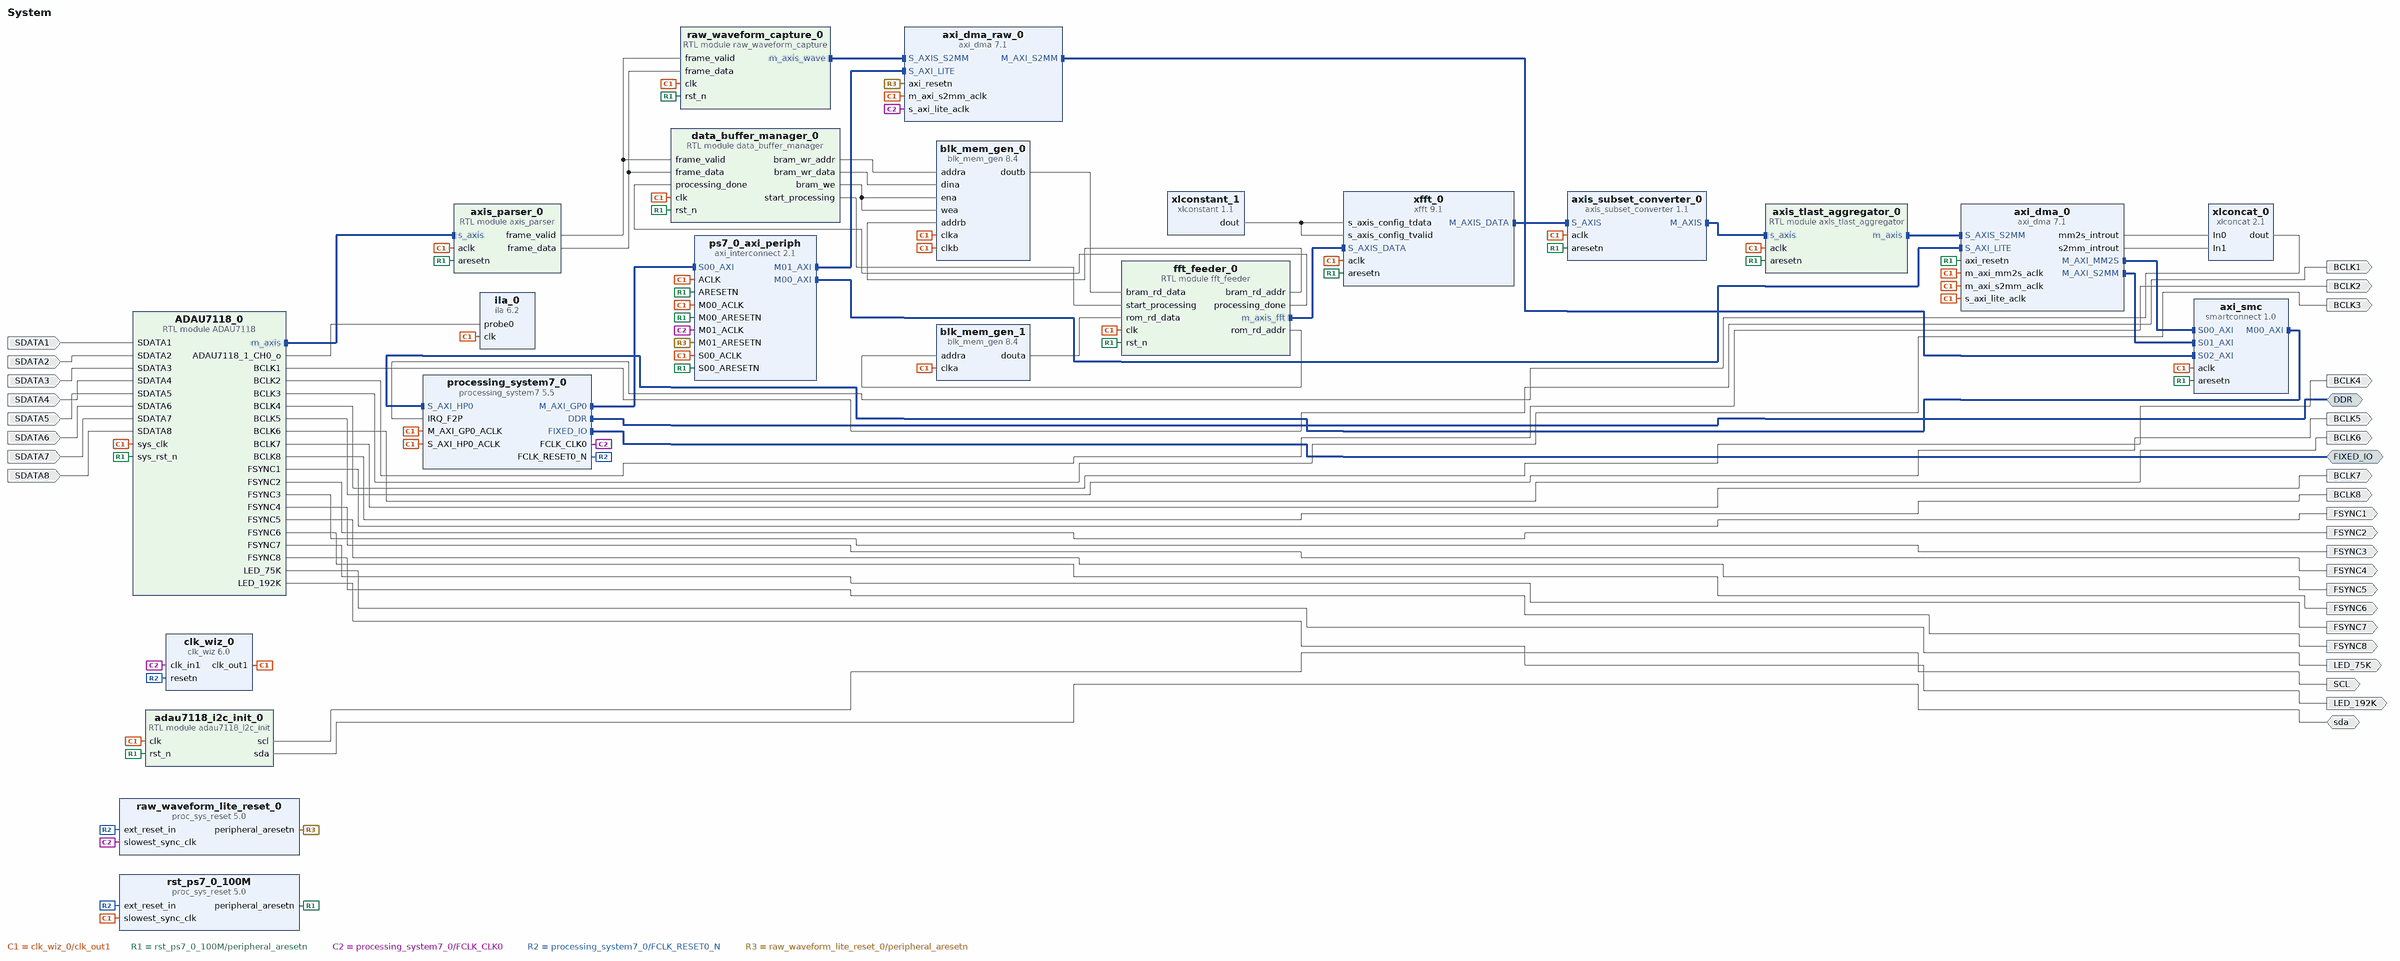
[diagram p0: block diagram of the top level]
# Vivado block design System, xc7z020clg400-2, Vivado 2018.3
create_bd_design System

create_bd_intf_port -mode Master -vlnv xilinx.com:interface:ddrx_rtl:1.0 DDR
create_bd_intf_port -mode Master -vlnv xilinx.com:display_processing_system7:fixedio_rtl:1.0 FIXED_IO
create_bd_port -dir I SDATA1
create_bd_port -dir I SDATA2
create_bd_port -dir I SDATA3
create_bd_port -dir I SDATA4
create_bd_port -dir I SDATA5
create_bd_port -dir I SDATA6
create_bd_port -dir I SDATA7
create_bd_port -dir I SDATA8
create_bd_port -dir O BCLK1
create_bd_port -dir O BCLK2
create_bd_port -dir O BCLK3
create_bd_port -dir O BCLK4
create_bd_port -dir O BCLK5
create_bd_port -dir O BCLK6
create_bd_port -dir O BCLK7
create_bd_port -dir O BCLK8
create_bd_port -dir O FSYNC1
create_bd_port -dir O FSYNC2
create_bd_port -dir O FSYNC3
create_bd_port -dir O FSYNC4
create_bd_port -dir O FSYNC5
create_bd_port -dir O FSYNC6
create_bd_port -dir O FSYNC7
create_bd_port -dir O FSYNC8
create_bd_port -dir O SCL
create_bd_port -dir IO sda
create_bd_port -dir O LED_75K
create_bd_port -dir O LED_192K

create_bd_cell -type module -reference axis_parser axis_parser_0
create_bd_cell -type module -reference data_buffer_manager data_buffer_manager_0
create_bd_cell -type module -reference axis_tlast_aggregator axis_tlast_aggregator_0
create_bd_cell -type module -reference fft_feeder fft_feeder_0
create_bd_cell -type ip -vlnv xilinx.com:ip:axi_dma:7.1 axi_dma_0
set_property -dict [list \
  CONFIG.c_addr_width 32 \
  CONFIG.c_include_mm2s_dre 1 \
  CONFIG.c_include_s2mm 1 \
  CONFIG.c_include_s2mm_dre 1 \
  CONFIG.c_include_sg 0 \
  CONFIG.c_m_axi_mm2s_data_width 128 \
  CONFIG.c_m_axi_s2mm_data_width 64 \
  CONFIG.c_m_axis_mm2s_tdata_width 128 \
  CONFIG.c_mm2s_burst_size 256 \
  CONFIG.c_s2mm_burst_size 32 \
  CONFIG.c_sg_length_width 23 \
] [get_bd_cells axi_dma_0]
create_bd_cell -type ip -vlnv xilinx.com:ip:smartconnect:1.0 axi_smc
set_property -dict {CONFIG.NUM_SI 3} [get_bd_cells axi_smc]
create_bd_cell -type ip -vlnv xilinx.com:ip:axis_subset_converter:1.1 axis_subset_converter_0
set_property -dict [list \
  CONFIG.M_HAS_TLAST 1 \
  CONFIG.M_TDATA_NUM_BYTES 8 \
  CONFIG.M_TUSER_WIDTH 8 \
  CONFIG.S_HAS_TLAST 1 \
  CONFIG.S_TDATA_NUM_BYTES 6 \
  CONFIG.S_TUSER_WIDTH 8 \
  CONFIG.TDATA_REMAP {16'b0,tdata[47:0]} \
  CONFIG.TLAST_REMAP {tlast[0]} \
  CONFIG.TUSER_REMAP {tuser[7:0]} \
] [get_bd_cells axis_subset_converter_0]
create_bd_cell -type ip -vlnv xilinx.com:ip:blk_mem_gen:8.4 blk_mem_gen_0
set_property -dict [list \
  CONFIG.Assume_Synchronous_Clk true \
  CONFIG.Enable_32bit_Address false \
  CONFIG.Enable_A Use_ENA_Pin \
  CONFIG.Enable_B Always_Enabled \
  CONFIG.Memory_Type True_Dual_Port_RAM \
  CONFIG.Port_B_Clock 100 \
  CONFIG.Port_B_Enable_Rate 100 \
  CONFIG.Port_B_Write_Rate 50 \
  CONFIG.Read_Width_A 1024 \
  CONFIG.Read_Width_B 1024 \
  CONFIG.Register_PortA_Output_of_Memory_Primitives false \
  CONFIG.Register_PortB_Output_of_Memory_Primitives true \
  CONFIG.Use_Byte_Write_Enable false \
  CONFIG.Use_RSTA_Pin false \
  CONFIG.Write_Depth_A 128 \
  CONFIG.Write_Width_A 1024 \
  CONFIG.Write_Width_B 1024 \
  CONFIG.use_bram_block Stand_Alone \
] [get_bd_cells blk_mem_gen_0]
create_bd_cell -type ip -vlnv xilinx.com:ip:blk_mem_gen:8.4 blk_mem_gen_1
set_property -dict [list \
  CONFIG.Coe_File ../../../../../../hanning_128.coe \
  CONFIG.Enable_32bit_Address false \
  CONFIG.Enable_A Always_Enabled \
  CONFIG.Fill_Remaining_Memory_Locations true \
  CONFIG.Load_Init_File true \
  CONFIG.Memory_Type Single_Port_ROM \
  CONFIG.Port_A_Write_Rate 0 \
  CONFIG.Register_PortA_Output_of_Memory_Primitives true \
  CONFIG.Use_RSTA_Pin false \
  CONFIG.Write_Depth_A 128 \
  CONFIG.Write_Width_A 16 \
  CONFIG.use_bram_block Stand_Alone \
] [get_bd_cells blk_mem_gen_1]
create_bd_cell -type ip -vlnv xilinx.com:ip:clk_wiz:6.0 clk_wiz_0
set_property -dict [list \
  CONFIG.CLKOUT1_JITTER 188.932 \
  CONFIG.CLKOUT1_PHASE_ERROR 297.349 \
  CONFIG.CLKOUT1_REQUESTED_OUT_FREQ 196.608 \
  CONFIG.CLKOUT2_JITTER 221.222 \
  CONFIG.CLKOUT2_PHASE_ERROR 117.869 \
  CONFIG.CLKOUT2_REQUESTED_OUT_FREQ 12.288 \
  CONFIG.CLKOUT2_USED false \
  CONFIG.MMCM_CLKFBOUT_MULT_F 57.750 \
  CONFIG.MMCM_CLKOUT0_DIVIDE_F 5.875 \
  CONFIG.MMCM_CLKOUT1_DIVIDE 1 \
  CONFIG.MMCM_DIVCLK_DIVIDE 5 \
  CONFIG.NUM_OUT_CLKS 1 \
  CONFIG.RESET_PORT resetn \
  CONFIG.RESET_TYPE ACTIVE_LOW \
  CONFIG.USE_LOCKED false \
] [get_bd_cells clk_wiz_0]
create_bd_cell -type ip -vlnv xilinx.com:ip:ila:6.2 ila_0
set_property -dict [list \
  CONFIG.C_DATA_DEPTH 8192 \
  CONFIG.C_ENABLE_ILA_AXI_MON false \
  CONFIG.C_MONITOR_TYPE Native \
  CONFIG.C_NUM_OF_PROBES 1 \
  CONFIG.C_PROBE1_WIDTH 1 \
  CONFIG.C_PROBE2_WIDTH 1 \
  CONFIG.C_PROBE3_WIDTH 1 \
] [get_bd_cells ila_0]
create_bd_cell -type ip -vlnv xilinx.com:ip:processing_system7:5.5 processing_system7_0
set_property -dict [list \
  CONFIG.PCW_APU_PERIPHERAL_FREQMHZ 666.666666 \
  CONFIG.PCW_CPU_CPU_6X4X_MAX_RANGE 767 \
  CONFIG.PCW_ENET0_ENET0_IO {MIO 16 .. 27} \
  CONFIG.PCW_ENET0_GRP_MDIO_ENABLE 1 \
  CONFIG.PCW_ENET0_GRP_MDIO_IO {MIO 52 .. 53} \
  CONFIG.PCW_ENET0_PERIPHERAL_ENABLE 1 \
  CONFIG.PCW_FPGA0_PERIPHERAL_FREQMHZ 100 \
  CONFIG.PCW_FPGA1_PERIPHERAL_FREQMHZ 50 \
  CONFIG.PCW_GPIO_MIO_GPIO_ENABLE 0 \
  CONFIG.PCW_IRQ_F2P_INTR 1 \
  CONFIG.PCW_PERIPHERAL_BOARD_PRESET None \
  CONFIG.PCW_PRESET_BANK1_VOLTAGE {LVCMOS 1.8V} \
  CONFIG.PCW_QSPI_GRP_SINGLE_SS_ENABLE 1 \
  CONFIG.PCW_QSPI_GRP_SINGLE_SS_IO {MIO 1 .. 6} \
  CONFIG.PCW_QSPI_PERIPHERAL_ENABLE 1 \
  CONFIG.PCW_QSPI_QSPI_IO {MIO 1 .. 6} \
  CONFIG.PCW_SD0_GRP_CD_ENABLE 0 \
  CONFIG.PCW_SD0_GRP_WP_ENABLE 0 \
  CONFIG.PCW_SD0_PERIPHERAL_ENABLE 1 \
  CONFIG.PCW_SD0_SD0_IO {MIO 40 .. 45} \
  CONFIG.PCW_SDIO_PERIPHERAL_FREQMHZ 100 \
  CONFIG.PCW_SINGLE_QSPI_DATA_MODE x4 \
  CONFIG.PCW_UART0_PERIPHERAL_ENABLE 1 \
  CONFIG.PCW_UART0_UART0_IO {MIO 46 .. 47} \
  CONFIG.PCW_UART1_PERIPHERAL_ENABLE 0 \
  CONFIG.PCW_UART_PERIPHERAL_FREQMHZ 100 \
  CONFIG.PCW_UIPARAM_DDR_FREQ_MHZ 533.333333 \
  CONFIG.PCW_UIPARAM_DDR_MEMORY_TYPE {DDR 3 (Low Voltage)} \
  CONFIG.PCW_UIPARAM_DDR_PARTNO {MT41K256M16 RE-125} \
  CONFIG.PCW_USB0_PERIPHERAL_ENABLE 0 \
  CONFIG.PCW_USE_FABRIC_INTERRUPT 1 \
  CONFIG.PCW_USE_S_AXI_HP0 1 \
] [get_bd_cells processing_system7_0]
# 429 more settings of processing_system7_0 are not shown: defaults, MIO pin electricals, DDR timing, and values the tool derives
create_bd_cell -type ip -vlnv xilinx.com:ip:axi_interconnect:2.1 ps7_0_axi_periph
set_property -dict {CONFIG.NUM_MI 2} [get_bd_cells ps7_0_axi_periph]
create_bd_cell -type ip -vlnv xilinx.com:ip:proc_sys_reset:5.0 rst_ps7_0_100M
create_bd_cell -type ip -vlnv xilinx.com:ip:xfft:9.1 xfft_0
set_property -dict [list \
  CONFIG.aresetn true \
  CONFIG.implementation_options pipelined_streaming_io \
  CONFIG.number_of_stages_using_block_ram_for_data_and_phase_factors 0 \
  CONFIG.output_ordering natural_order \
  CONFIG.scaling_options unscaled \
  CONFIG.target_clock_frequency 100 \
  CONFIG.transform_length 128 \
  CONFIG.xk_index true \
] [get_bd_cells xfft_0]
create_bd_cell -type ip -vlnv xilinx.com:ip:xlconcat:2.1 xlconcat_0
create_bd_cell -type ip -vlnv xilinx.com:ip:xlconstant:1.1 xlconstant_1
set_property -dict {CONFIG.CONST_WIDTH 8} [get_bd_cells xlconstant_1]
create_bd_cell -type ip -vlnv xilinx.com:ip:axi_dma:7.1 axi_dma_raw_0
set_property -dict [list \
  CONFIG.c_include_mm2s 0 \
  CONFIG.c_include_s2mm 1 \
  CONFIG.c_include_s2mm_dre 1 \
  CONFIG.c_include_sg 0 \
  CONFIG.c_m_axi_s2mm_data_width 64 \
  CONFIG.c_s2mm_burst_size 32 \
] [get_bd_cells axi_dma_raw_0]
create_bd_cell -type ip -vlnv xilinx.com:ip:proc_sys_reset:5.0 raw_waveform_lite_reset_0
create_bd_cell -type module -reference raw_waveform_capture raw_waveform_capture_0
create_bd_cell -type module -reference adau7118_i2c_init adau7118_i2c_init_0
set_property -dict {CONFIG.CLK_FREQ 196608000 CONFIG.DEC_RATIO_CLK_MAP_VALUE 0xC1} [get_bd_cells adau7118_i2c_init_0]
create_bd_cell -type module -reference ADAU7118 ADAU7118_0
set_property -dict {CONFIG.BCLK_FREQ 24576000 CONFIG.SYS_CLK_FREQ 196608000} [get_bd_cells ADAU7118_0]

# ---- connections ----

connect_bd_intf_net [get_bd_intf_pins axi_dma_0/M_AXI_MM2S] [get_bd_intf_pins axi_smc/S00_AXI]
connect_bd_intf_net [get_bd_intf_pins axis_parser_0/s_axis] [get_bd_intf_pins ADAU7118_0/m_axis]
connect_bd_intf_net [get_bd_intf_pins axi_dma_raw_0/M_AXI_S2MM] [get_bd_intf_pins axi_smc/S02_AXI]
connect_bd_intf_net [get_bd_intf_pins ps7_0_axi_periph/M00_AXI] [get_bd_intf_pins axi_dma_0/S_AXI_LITE]
connect_bd_intf_net [get_bd_intf_pins axi_dma_0/M_AXI_S2MM] [get_bd_intf_pins axi_smc/S01_AXI]
connect_bd_intf_net [get_bd_intf_pins xfft_0/M_AXIS_DATA] [get_bd_intf_pins axis_subset_converter_0/S_AXIS]
connect_bd_intf_net [get_bd_intf_pins ps7_0_axi_periph/M01_AXI] [get_bd_intf_pins axi_dma_raw_0/S_AXI_LITE]
connect_bd_intf_net [get_bd_intf_pins raw_waveform_capture_0/m_axis_wave] [get_bd_intf_pins axi_dma_raw_0/S_AXIS_S2MM]
connect_bd_intf_net [get_bd_intf_ports DDR] [get_bd_intf_pins processing_system7_0/DDR]
connect_bd_intf_net [get_bd_intf_pins axis_tlast_aggregator_0/m_axis] [get_bd_intf_pins axi_dma_0/S_AXIS_S2MM]
connect_bd_intf_net [get_bd_intf_ports FIXED_IO] [get_bd_intf_pins processing_system7_0/FIXED_IO]
connect_bd_intf_net [get_bd_intf_pins xfft_0/S_AXIS_DATA] [get_bd_intf_pins fft_feeder_0/m_axis_fft]
connect_bd_intf_net [get_bd_intf_pins axis_subset_converter_0/M_AXIS] [get_bd_intf_pins axis_tlast_aggregator_0/s_axis]
connect_bd_intf_net [get_bd_intf_pins processing_system7_0/M_AXI_GP0] [get_bd_intf_pins ps7_0_axi_periph/S00_AXI]
connect_bd_intf_net [get_bd_intf_pins axi_smc/M00_AXI] [get_bd_intf_pins processing_system7_0/S_AXI_HP0]
connect_bd_net -net processing_system7_0_FCLK_CLK0 [get_bd_pins clk_wiz_0/clk_out1] \
  [get_bd_pins axis_parser_0/aclk] [get_bd_pins data_buffer_manager_0/clk] [get_bd_pins axis_tlast_aggregator_0/aclk] \
  [get_bd_pins fft_feeder_0/clk] [get_bd_pins axi_dma_0/s_axi_lite_aclk] [get_bd_pins axi_dma_0/m_axi_mm2s_aclk] \
  [get_bd_pins axi_dma_0/m_axi_s2mm_aclk] [get_bd_pins axi_smc/aclk] [get_bd_pins axis_subset_converter_0/aclk] \
  [get_bd_pins blk_mem_gen_0/clka] [get_bd_pins blk_mem_gen_0/clkb] [get_bd_pins blk_mem_gen_1/clka] [get_bd_pins ila_0/clk] \
  [get_bd_pins processing_system7_0/M_AXI_GP0_ACLK] [get_bd_pins processing_system7_0/S_AXI_HP0_ACLK] \
  [get_bd_pins ps7_0_axi_periph/ACLK] [get_bd_pins ps7_0_axi_periph/S00_ACLK] [get_bd_pins ps7_0_axi_periph/M00_ACLK] \
  [get_bd_pins rst_ps7_0_100M/slowest_sync_clk] [get_bd_pins xfft_0/aclk] [get_bd_pins axi_dma_raw_0/m_axi_s2mm_aclk] \
  [get_bd_pins raw_waveform_capture_0/clk] [get_bd_pins adau7118_i2c_init_0/clk] [get_bd_pins ADAU7118_0/sys_clk]
connect_bd_net [get_bd_pins rst_ps7_0_100M/peripheral_aresetn] \
  [get_bd_pins axis_parser_0/aresetn] [get_bd_pins data_buffer_manager_0/rst_n] [get_bd_pins axis_tlast_aggregator_0/aresetn] \
  [get_bd_pins fft_feeder_0/rst_n] [get_bd_pins axi_dma_0/axi_resetn] [get_bd_pins axi_smc/aresetn] \
  [get_bd_pins axis_subset_converter_0/aresetn] [get_bd_pins ps7_0_axi_periph/ARESETN] \
  [get_bd_pins ps7_0_axi_periph/S00_ARESETN] [get_bd_pins ps7_0_axi_periph/M00_ARESETN] [get_bd_pins xfft_0/aresetn] \
  [get_bd_pins raw_waveform_capture_0/rst_n] [get_bd_pins adau7118_i2c_init_0/rst_n] [get_bd_pins ADAU7118_0/sys_rst_n]
connect_bd_net [get_bd_pins xlconcat_0/dout] [get_bd_pins processing_system7_0/IRQ_F2P]
connect_bd_net [get_bd_pins axi_dma_0/mm2s_introut] [get_bd_pins xlconcat_0/In0]
connect_bd_net [get_bd_pins axis_parser_0/frame_valid] \
  [get_bd_pins data_buffer_manager_0/frame_valid] [get_bd_pins raw_waveform_capture_0/frame_valid]
connect_bd_net [get_bd_pins data_buffer_manager_0/bram_wr_addr] [get_bd_pins blk_mem_gen_0/addra]
connect_bd_net [get_bd_pins data_buffer_manager_0/bram_wr_data] [get_bd_pins blk_mem_gen_0/dina]
connect_bd_net [get_bd_pins data_buffer_manager_0/bram_we] [get_bd_pins blk_mem_gen_0/ena] [get_bd_pins blk_mem_gen_0/wea]
connect_bd_net [get_bd_pins data_buffer_manager_0/start_processing] [get_bd_pins fft_feeder_0/start_processing]
connect_bd_net [get_bd_pins fft_feeder_0/processing_done] [get_bd_pins data_buffer_manager_0/processing_done]
connect_bd_net [get_bd_pins fft_feeder_0/bram_rd_addr] [get_bd_pins blk_mem_gen_0/addrb]
connect_bd_net [get_bd_pins blk_mem_gen_0/doutb] [get_bd_pins fft_feeder_0/bram_rd_data]
connect_bd_net [get_bd_pins fft_feeder_0/rom_rd_addr] [get_bd_pins blk_mem_gen_1/addra]
connect_bd_net [get_bd_pins blk_mem_gen_1/douta] [get_bd_pins fft_feeder_0/rom_rd_data]
connect_bd_net [get_bd_pins axis_parser_0/frame_data] [get_bd_pins data_buffer_manager_0/frame_data] [get_bd_pins raw_waveform_capture_0/frame_data]
connect_bd_net [get_bd_pins xlconstant_1/dout] [get_bd_pins xfft_0/s_axis_config_tdata] [get_bd_pins xfft_0/s_axis_config_tvalid]
connect_bd_net [get_bd_pins axi_dma_0/s2mm_introut] [get_bd_pins xlconcat_0/In1]
connect_bd_net -net SDATA1_1 [get_bd_ports SDATA1] [get_bd_pins ADAU7118_0/SDATA1]
connect_bd_net -net SDATA2_1 [get_bd_ports SDATA2] [get_bd_pins ADAU7118_0/SDATA2]
connect_bd_net -net SDATA3_1 [get_bd_ports SDATA3] [get_bd_pins ADAU7118_0/SDATA3]
connect_bd_net -net SDATA4_1 [get_bd_ports SDATA4] [get_bd_pins ADAU7118_0/SDATA4]
connect_bd_net -net SDATA5_1 [get_bd_ports SDATA5] [get_bd_pins ADAU7118_0/SDATA5]
connect_bd_net -net SDATA6_1 [get_bd_ports SDATA6] [get_bd_pins ADAU7118_0/SDATA6]
connect_bd_net -net SDATA7_1 [get_bd_ports SDATA7] [get_bd_pins ADAU7118_0/SDATA7]
connect_bd_net -net SDATA8_1 [get_bd_ports SDATA8] [get_bd_pins ADAU7118_0/SDATA8]
connect_bd_net [get_bd_pins ADAU7118_0/BCLK1] [get_bd_ports BCLK1]
connect_bd_net [get_bd_pins ADAU7118_0/BCLK2] [get_bd_ports BCLK2]
connect_bd_net [get_bd_pins ADAU7118_0/BCLK3] [get_bd_ports BCLK3]
connect_bd_net [get_bd_pins ADAU7118_0/BCLK4] [get_bd_ports BCLK4]
connect_bd_net [get_bd_pins ADAU7118_0/BCLK5] [get_bd_ports BCLK5]
connect_bd_net [get_bd_pins ADAU7118_0/BCLK6] [get_bd_ports BCLK6]
connect_bd_net [get_bd_pins ADAU7118_0/BCLK7] [get_bd_ports BCLK7]
connect_bd_net [get_bd_pins ADAU7118_0/BCLK8] [get_bd_ports BCLK8]
connect_bd_net [get_bd_pins ADAU7118_0/FSYNC1] [get_bd_ports FSYNC1]
connect_bd_net [get_bd_pins ADAU7118_0/FSYNC2] [get_bd_ports FSYNC2]
connect_bd_net [get_bd_pins ADAU7118_0/FSYNC3] [get_bd_ports FSYNC3]
connect_bd_net [get_bd_pins ADAU7118_0/FSYNC4] [get_bd_ports FSYNC4]
connect_bd_net [get_bd_pins ADAU7118_0/FSYNC5] [get_bd_ports FSYNC5]
connect_bd_net [get_bd_pins ADAU7118_0/FSYNC6] [get_bd_ports FSYNC6]
connect_bd_net [get_bd_pins ADAU7118_0/FSYNC7] [get_bd_ports FSYNC7]
connect_bd_net [get_bd_pins ADAU7118_0/FSYNC8] [get_bd_ports FSYNC8]
connect_bd_net [get_bd_pins processing_system7_0/FCLK_CLK0] \
  [get_bd_pins clk_wiz_0/clk_in1] [get_bd_pins axi_dma_raw_0/s_axi_lite_aclk] [get_bd_pins ps7_0_axi_periph/M01_ACLK] \
  [get_bd_pins raw_waveform_lite_reset_0/slowest_sync_clk]
connect_bd_net [get_bd_pins processing_system7_0/FCLK_RESET0_N] \
  [get_bd_pins clk_wiz_0/resetn] [get_bd_pins rst_ps7_0_100M/ext_reset_in] \
  [get_bd_pins raw_waveform_lite_reset_0/ext_reset_in]
connect_bd_net [get_bd_pins ADAU7118_0/ADAU7118_1_CH0_o] [get_bd_pins ila_0/probe0]
connect_bd_net [get_bd_pins adau7118_i2c_init_0/scl] [get_bd_ports SCL]
connect_bd_net [get_bd_ports sda] [get_bd_pins adau7118_i2c_init_0/sda]
connect_bd_net [get_bd_pins raw_waveform_lite_reset_0/peripheral_aresetn] \
  [get_bd_pins axi_dma_raw_0/axi_resetn] [get_bd_pins ps7_0_axi_periph/M01_ARESETN]
connect_bd_net [get_bd_pins ADAU7118_0/LED_75K] [get_bd_ports LED_75K]
connect_bd_net [get_bd_pins ADAU7118_0/LED_192K] [get_bd_ports LED_192K]

# ---- address map ----
assign_bd_address -offset 0x00000000 -range 1G -target_address_space [get_bd_addr_spaces axi_dma_0/Data_MM2S] [get_bd_addr_segs processing_system7_0/S_AXI_HP0/HP0_DDR_LOWOCM]
assign_bd_address -offset 0x00000000 -range 1G -target_address_space [get_bd_addr_spaces axi_dma_0/Data_S2MM] [get_bd_addr_segs processing_system7_0/S_AXI_HP0/HP0_DDR_LOWOCM]
assign_bd_address -offset 0x00000000 -range 1G -target_address_space [get_bd_addr_spaces axi_dma_raw_0/Data_S2MM] [get_bd_addr_segs processing_system7_0/S_AXI_HP0/HP0_DDR_LOWOCM]
assign_bd_address -offset 0x40000000 -range 64K -target_address_space [get_bd_addr_spaces processing_system7_0/Data] [get_bd_addr_segs axi_dma_raw_0/S_AXI_LITE/Reg]
assign_bd_address -offset 0x40400000 -range 4M -target_address_space [get_bd_addr_spaces processing_system7_0/Data] [get_bd_addr_segs axi_dma_0/S_AXI_LITE/Reg]

validate_bd_design
save_bd_design
